# Altium schematic sheet ExternalInterface.SchDoc: Aquisição analógica externa
size 420 x 297 mm; Author: Matheus Markies; DrawnBy: Matheus Markies; Engineer: Matheus Markies; DocumentNumber: ECTU-SCH-03; Revision: A definir; SheetNumber: 3; SheetTotal: 12; ProjectTitle: ROUTE ECU / ECTU; DocumentStatus: Em desenvolvimento; DocumentDate: 14/10/2026
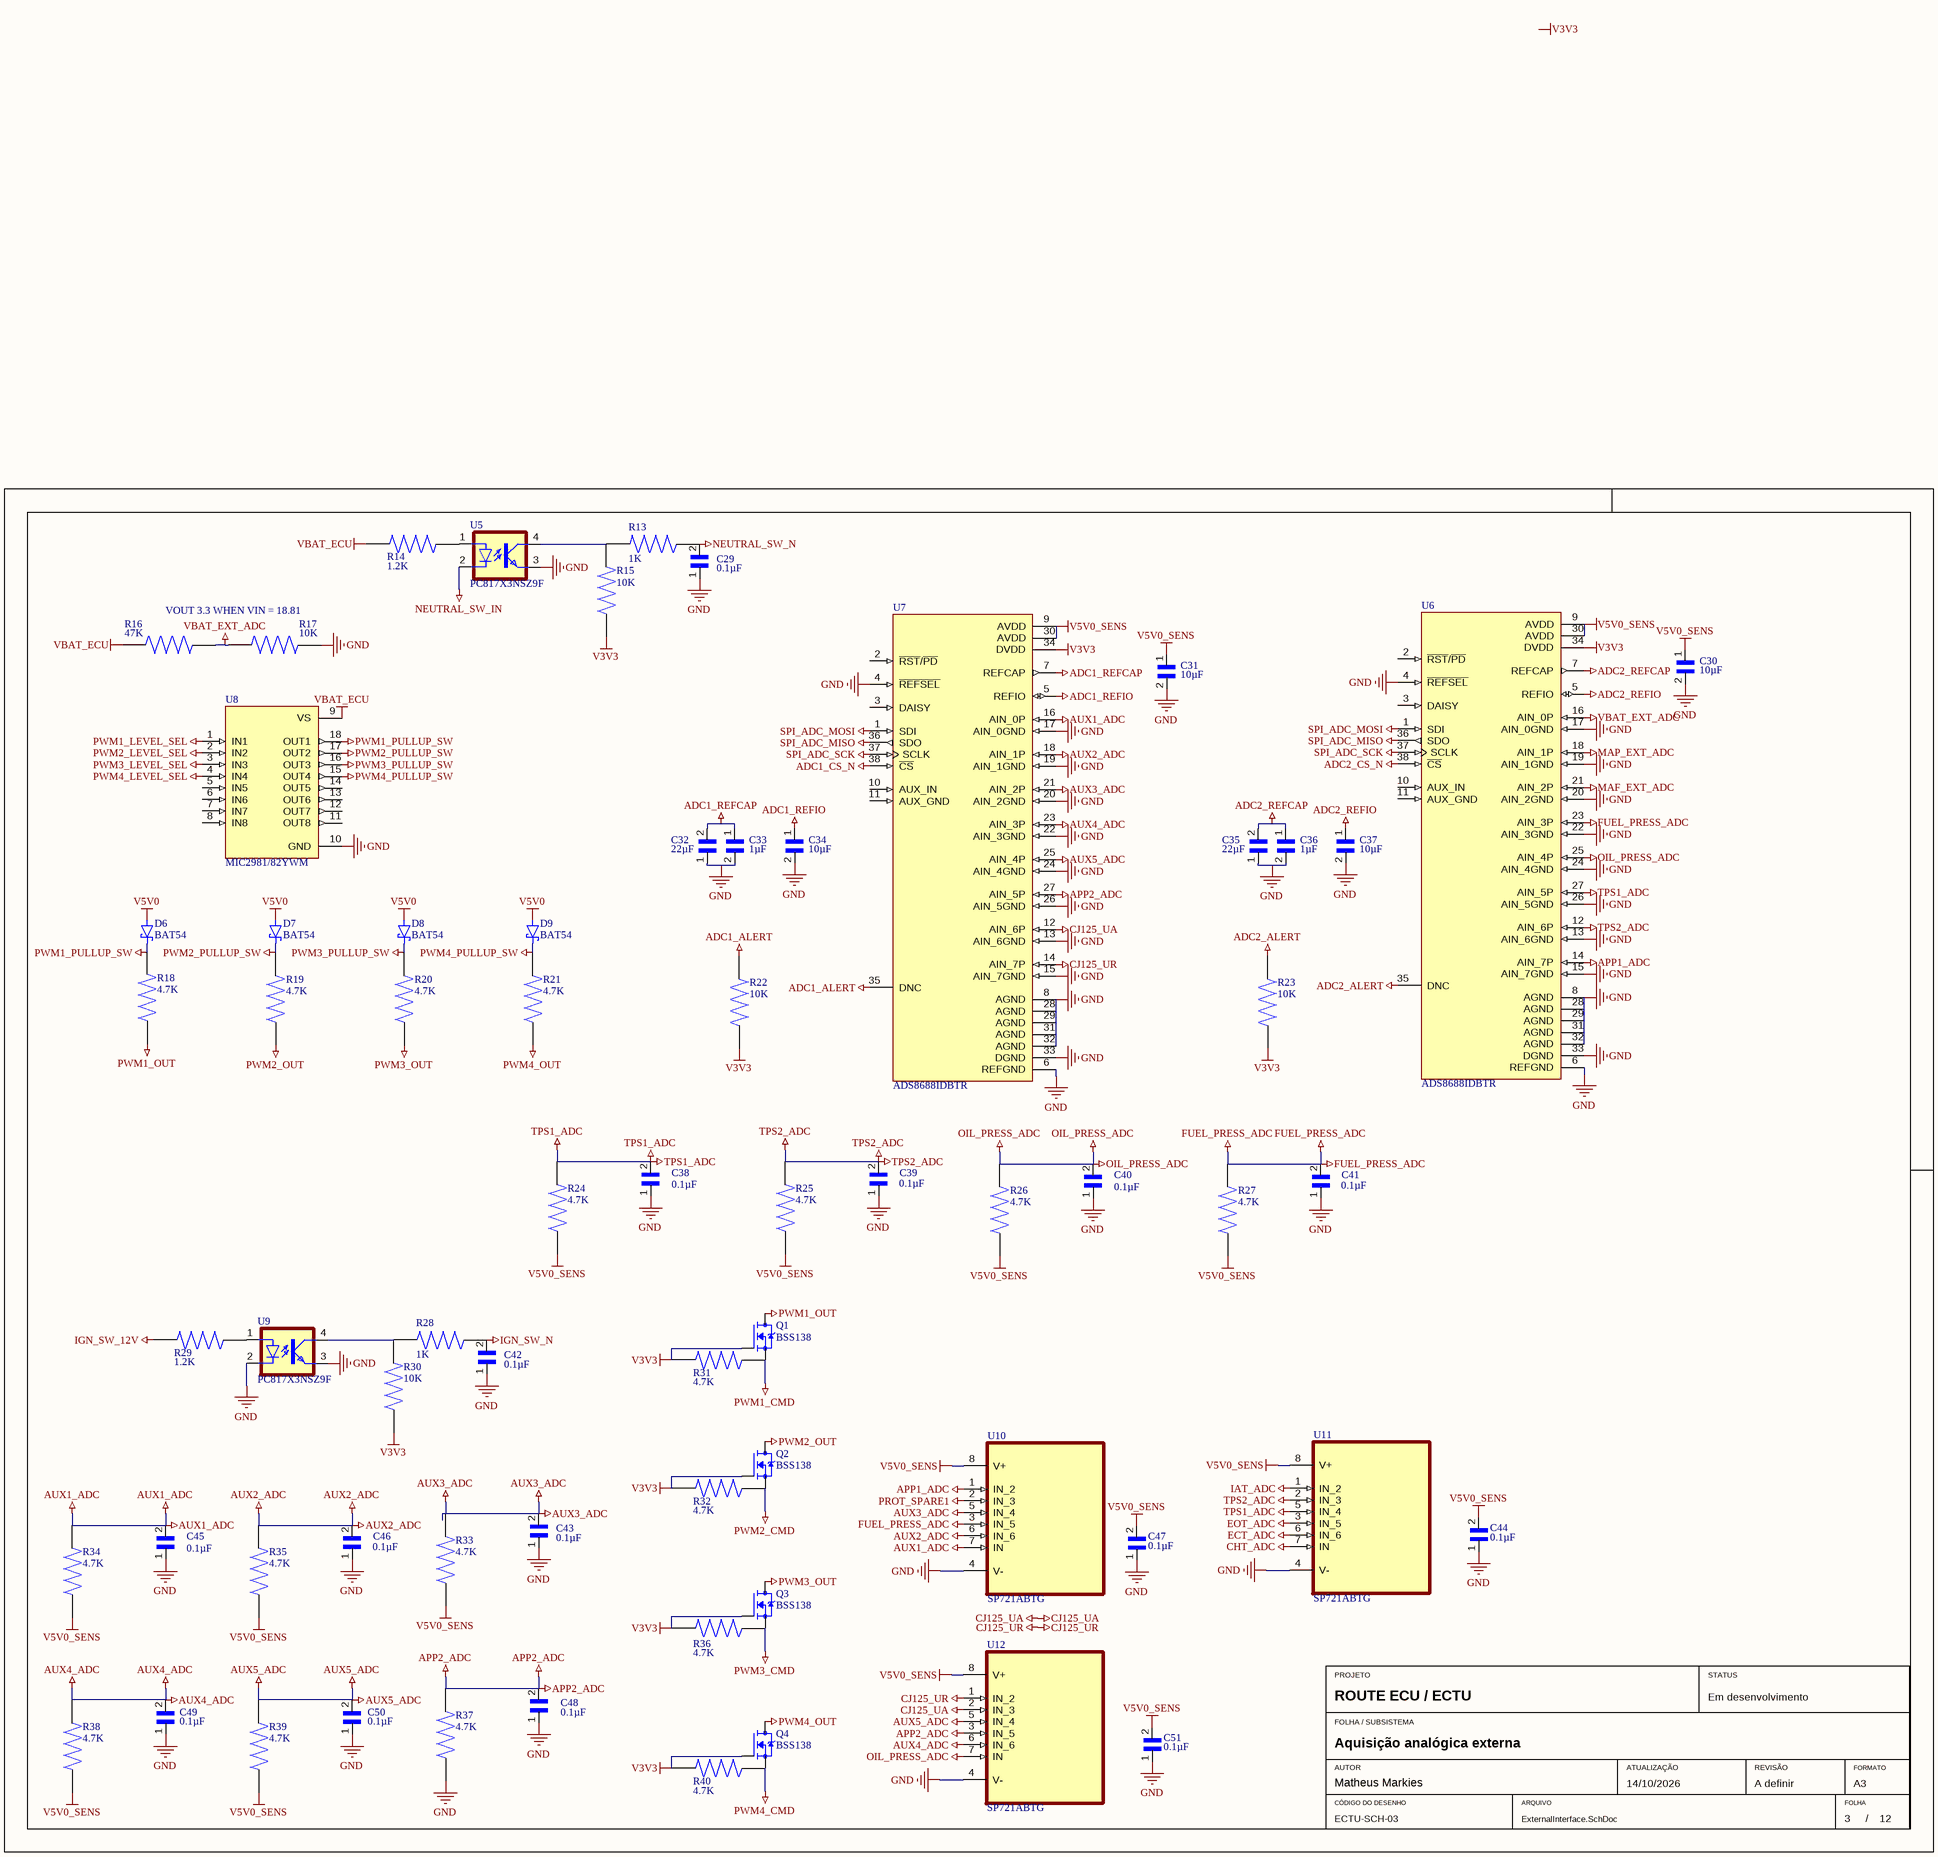
[diagram p0: ExternalInterface.SchDoc]

## Parts
C29  0.1µF  [CAPC1608X90N]
C30  10µF  [CAPC1608X90N]
C31  10µF  [CAPC1608X90N]
C32  22µF  [CAPC1608X90N]
C33  1µF  [CAPC1608X90N]
C34  10µF  [CAPC1608X90N]
C35  22µF  [CAPC1608X90N]
C36  1µF  [CAPC1608X90N]
C37  10µF  [CAPC1608X90N]
C38  0.1µF  [CAPC1608X90N]
C39  0.1µF  [CAPC1608X90N]
C40  0.1µF  [CAPC1608X90N]
C41  0.1µF  [CAPC1608X90N]
C42  0.1µF  [CAPC1608X90N]
C43  0.1µF  [CAPC1608X90N]
C44  0.1µF  [CAPC1608X90N]
C45  0.1µF  [CAPC1608X90N]
C46  0.1µF  [CAPC1608X90N]
C47  0.1µF  [CAPC1608X90N]
C48  0.1µF  [CAPC1608X90N]
C49  0.1µF  [CAPC1608X90N]
C50  0.1µF  [CAPC1608X90N]
C51  0.1µF  [CAPC1608X90N]
D6  BAT54  [SOT23]
D7  BAT54  [SOT23]
D8  BAT54  [SOT23]
D9  BAT54  [SOT23]
Q1  BSS138  [SOT95P240X111-3N]
Q2  BSS138  [SOT95P240X111-3N]
Q3  BSS138  [SOT95P240X111-3N]
Q4  BSS138  [SOT95P240X111-3N]
R13  1K  [RESC3116X65N]
R14  1.2K  [RESC3116X65N]
R15  10K  [RESC3116X65N]
R16  47K  [RESC3116X65N]
R17  10K  [RESC3116X65N]
R18  4.7K  [RESC3116X65N]
R19  4.7K  [RESC3116X65N]
R20  4.7K  [RESC3116X65N]
R21  4.7K  [RESC3116X65N]
R22  10K  [RESC3116X65N]
R23  10K  [RESC3116X65N]
R24  4.7K  [RESC3116X65N]
R25  4.7K  [RESC3116X65N]
R26  4.7K  [RESC3116X65N]
R27  4.7K  [RESC3116X65N]
R28  1K  [RESC3116X65N]
R29  1.2K  [RESC3116X65N]
R30  10K  [RESC3116X65N]
R31  4.7K  [RESC3116X65N]
R32  4.7K  [RESC3116X65N]
R33  4.7K  [RESC3116X65N]
R34  4.7K  [RESC3116X65N]
R35  4.7K  [RESC3116X65N]
R36  4.7K  [RESC3116X65N]
R37  4.7K  [RESC3116X65N]
R38  4.7K  [RESC3116X65N]
R39  4.7K  [RESC3116X65N]
R40  4.7K  [RESC3116X65N]
U5  PC817X3NSZ9F  [DIL04]
U6  ADS8688IDBTR  [SOP50P640X120-38N]
U7  ADS8688IDBTR  [SOP50P640X120-38N]
U8  MIC2981/82YWM  [SOP127P1031X261-18N]
U9  PC817X3NSZ9F  [DIL04]
U10  SP721ABTG  [SOIC127P600X175-8N]
U11  SP721ABTG  [SOIC127P600X175-8N]
U12  SP721ABTG  [SOIC127P600X175-8N]

## Nets
ADC1_ALERT: R22.1 U7.35(DNC)
ADC1_CS_N: U7.38(~{CS})
ADC1_REFCAP: C32.2 C33.1 U7.7(REFCAP)
ADC1_REFIO: C34.1 U7.5(REFIO)
ADC2_ALERT: R23.1 U6.35(DNC)
ADC2_CS_N: U6.38(~{CS})
ADC2_REFCAP: C35.2 C36.1 U6.7(REFCAP)
ADC2_REFIO: C37.1 U6.5(REFIO)
APP1_ADC: U6.14(AIN_7P) U10.1(IN_2)
APP2_ADC: C48.2 R37.2 U7.27(AIN_5P) U12.3(IN_5)
AUX1_ADC: C45.2 R34.2 U7.16(AIN_0P) U10.7(IN)
AUX2_ADC: C46.2 R35.2 U7.18(AIN_1P) U10.6(IN_6)
AUX3_ADC: C43.2 R33.2 U7.21(AIN_2P) U10.5(IN_4)
AUX4_ADC: C49.2 R38.2 U7.23(AIN_3P) U12.6(IN_6)
AUX5_ADC: C50.2 R39.2 U7.25(AIN_4P) U12.5(IN_4)
CHT_ADC: U11.7(IN)
CJ125_UA: U7.12(AIN_6P) U12.2(IN_3)
CJ125_UR: U7.14(AIN_7P) U12.1(IN_2)
ECT_ADC: U11.6(IN_6)
EOT_ADC: U11.3(IN_5)
FUEL_PRESS_ADC: C41.2 R27.2 U6.23(AIN_3P) U10.3(IN_5)
GND: C29.1 C30.2 C31.2 C32.1 C33.2 C34.2 C35.1 C36.2 C37.2 C38.1 C39.1 C40.1 C41.1 C42.1 C43.1 C44.1 C45.1 C46.1 C47.1 C48.1 C49.1 C50.1 C51.1 R17.2 R37.1 U5.3(EMIT) U6.4(~{REFSEL}) U6.6(REFGND) U6.8(AGND) U6.13(AIN_6GND) U6.15(AIN_7GND) U6.17(AIN_0GND) U6.19(AIN_1GND) U6.20(AIN_2GND) U6.22(AIN_3GND) U6.24(AIN_4GND) U6.26(AIN_5GND) U6.28(AGND) U6.29(AGND) U6.31(AGND) U6.32(AGND) U6.33(DGND) U7.4(~{REFSEL}) U7.6(REFGND) U7.8(AGND) U7.13(AIN_6GND) U7.15(AIN_7GND) U7.17(AIN_0GND) U7.19(AIN_1GND) U7.20(AIN_2GND) U7.22(AIN_3GND) U7.24(AIN_4GND) U7.26(AIN_5GND) U7.28(AGND) U7.29(AGND) U7.31(AGND) U7.32(AGND) U7.33(DGND) U8.10(GND) U9.2(C) U9.3(EMIT) U10.4(V-) U11.4(V-) U12.4(V-)
IAT_ADC: U11.1(IN_2)
IGN_SW_12V: R29.2
IGN_SW_N: C42.2 R28.1
MAF_EXT_ADC: U6.21(AIN_2P)
MAP_EXT_ADC: U6.18(AIN_1P)
NEUTRAL_SW_IN: U5.2(C)
NEUTRAL_SW_N: C29.2 R13.1
OIL_PRESS_ADC: C40.2 R26.2 U6.25(AIN_4P) U12.7(IN)
PROT_SPARE1: U10.2(IN_3)
PWM1_CMD: Q1.2(S) R31.1
PWM1_LEVEL_SEL: U8.1(IN1)
PWM1_OUT: Q1.3(D) R18.1
PWM1_PULLUP_SW: D6.3(C) R18.2 U8.18(OUT1)
PWM2_CMD: Q2.2(S) R32.1
PWM2_LEVEL_SEL: U8.2(IN2)
PWM2_OUT: Q2.3(D) R19.1
PWM2_PULLUP_SW: D7.3(C) R19.2 U8.17(OUT2)
PWM3_CMD: Q3.2(S) R36.1
PWM3_LEVEL_SEL: U8.3(IN3)
PWM3_OUT: Q3.3(D) R20.1
PWM3_PULLUP_SW: D8.3(C) R20.2 U8.16(OUT3)
PWM4_CMD: Q4.2(S) R40.1
PWM4_LEVEL_SEL: U8.4(IN4)
PWM4_OUT: Q4.3(D) R21.1
PWM4_PULLUP_SW: D9.3(C) R21.2 U8.15(OUT4)
SPI_ADC_MISO: U6.36(SDO) U7.36(SDO)
SPI_ADC_MOSI: U6.1(SDI) U7.1(SDI)
SPI_ADC_SCK: U6.37(SCLK) U7.37(SCLK)
TPS1_ADC: C38.2 R24.2 U6.27(AIN_5P) U11.5(IN_4)
TPS2_ADC: C39.2 R25.2 U6.12(AIN_6P) U11.2(IN_3)
V3V3: Q1.1(G) Q2.1(G) Q3.1(G) Q4.1(G) R15.1 R22.2 R23.2 R30.1 R31.2 R32.2 R36.2 R40.2 U6.34(DVDD) U7.34(DVDD)
V5V0: D6.1(A) D7.1(A) D8.1(A) D9.1(A)
V5V0_SENS: C30.1 C31.1 C44.2 C47.2 C51.2 R24.1 R25.1 R26.1 R27.1 R33.1 R34.1 R35.1 R38.1 R39.1 U6.9(AVDD) U6.30(AVDD) U7.9(AVDD) U7.30(AVDD) U10.8(V+) U11.8(V+) U12.8(V+)
VBAT_ECU: R14.2 R16.1 U8.9(VS)
VBAT_EXT_ADC: R16.2 R17.1 U6.16(AIN_0P)
NetR13_2: R13.2 R15.2 U5.4(COL)
NetR14_1: R14.1 U5.1(A)
NetR28_2: R28.2 R30.2 U9.4(COL)
NetR29_1: R29.1 U9.1(A)

Not connected (* = marked no-connect by the designer): U6 2(~{RST}/~{PD}) 3(DAISY) 10(AUX_IN) 11(AUX_GND); U7 2(~{RST}/~{PD}) 3(DAISY) 10(AUX_IN) 11(AUX_GND); U8 5(IN5) 6(IN6) 7(IN7) 8(IN8) 11(OUT8) 12(OUT7) 13(OUT6) 14(OUT5)

## Notes on the sheet
- VOUT 3.3 WHEN VIN = 18.81
- Labels drawn without touching a wire or pin: V3V3
- PROJETO
- STATUS
- FOLHA / SUBSISTEMA
- AUTOR
- CÓDIGO DO DESENHO
- ARQUIVO
- ATUALIZAÇÃO
- REVISÃO
- FOLHA
- FORMATO
- A3
- /

## Library data of the parts
C29-C51 = 06035C104MAZ2A: Multilayer Ceramic Capacitors MLCC - SMD/SMT; Package: None; Price: None; Value: *; MP: 06035C104MAZ2A; Availability: Unavailable
D6-D9 = BAT54: Diode Schottky 30 V 200mA Surface Mount SOT-523; MF: SMC Diode Solutions; SnapEDA_Link: https://www.snapeda.com/parts/BAT54/SMC/view-part/?ref=snap; Package: None; Value: *; MP: BAT54; Check_prices: https://www.snapeda.com/parts/BAT54/SMC/view-part/?ref=eda
Q1-Q4 = BSS138: N-Channel 50 V 220mA (Ta) 350mW (Ta) Surface Mount SOT-23-3; MF: onsemi; SnapEDA_Link: https://www.snapeda.com/parts/BSS138/Onsemi/view-part/?ref=snap; Package: SOT-23-3 ON Semiconductor; Value: *; MP: BSS138; Check_prices: https://www.snapeda.com/parts/BSS138/Onsemi/view-part/?ref=eda
R13-R15 R18-R21 R24-R40 = RC1206FR-074K7L: 4.7 kOhms Â±1% 0.25W, 1/4W Chip Resistor 1206 (3216 Metric) Moisture Resistant Thick Film; MF: Yageo; SnapEDA_Link: https://www.snapeda.com/parts/RC1206FR-074K7L/Yageo/view-part/?ref=snap; Package: 3116 Yageo; Value: *; MP: RC1206FR-074K7L; Check_prices: https://www.snapeda.com/parts/RC1206FR-074K7L/Yageo/view-part/?ref=eda
R16 R17 R22 R23 = AA1206JR-07470RL: Package: None; Price: None; Value: *; MP: AA1206JR-07470RL; Availability: Unavailable
U5 U9 = PC817X3NSZ9F: Optoisolator Transistor Output 5000Vrms 1 Channel 4-DIP; MF: Sharp Microelectronics; SnapEDA_Link: https://www.snapeda.com/parts/PC817X3NSZ9F/Sharp+Microelectronics/view-part/?ref=snap; Package: DIP-4 Sharp Microelectronics; Value: *; MP: PC817X3NSZ9F; Check_prices: https://www.snapeda.com/parts/PC817X3NSZ9F/Sharp+Microelectronics/view-part/?ref=eda
U8 = MIC2981/82YWM: Power Switch/Driver 1:1 Bipolar 500mA 18-SOP (Wide); MF: Microchip Technology; MP: MIC2981/82YWM-TR; SnapEDA_Link: https://www.snapeda.com/parts/MIC2981/82YWM-TR/Microchip/view-part/?ref=snap; Package: SOIC-18 Microchip; Value: *; Check_prices: https://www.snapeda.com/parts/MIC2981/82YWM-TR/Microchip/view-part/?ref=eda
U10-U12 = SP721ABTG: TVS Diode Arrays; Package: None; Price: None; Value: *; MP: SP721ABTG; Availability: Unavailable
U6 U7 = ADS8688IDBTR: Package: None; Price: None; Value: *; MP: ADS8688IDBTR; Availability: Unavailable